# EasyEDA Pro project ProProject_ESP32C3-1.54墨水屏-多功能_2024-05-25.epro, board PCB1
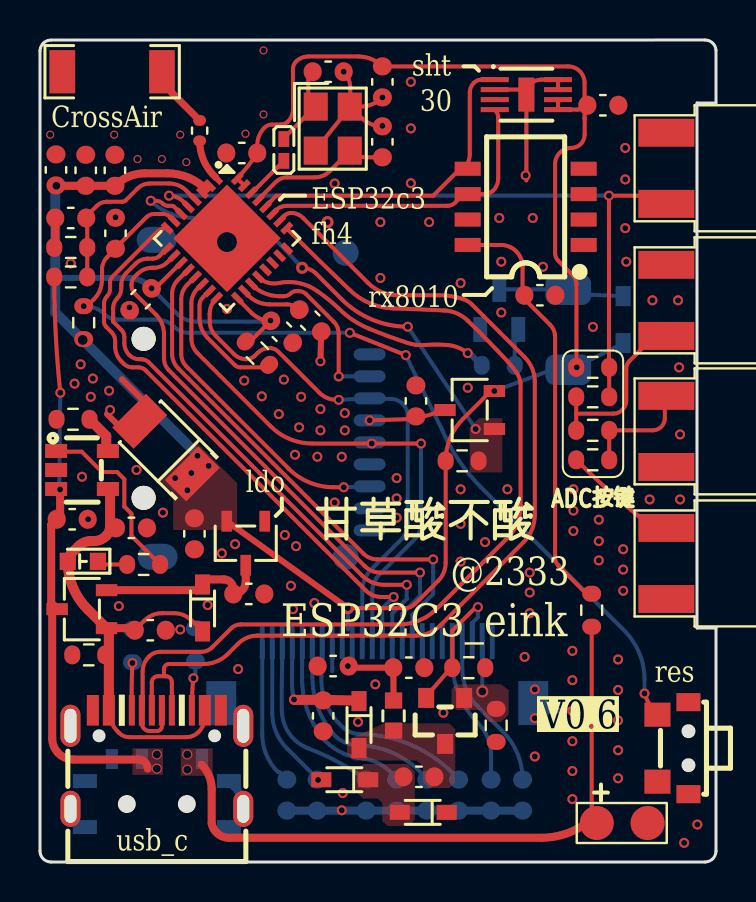
[diagram p1: board, top side]
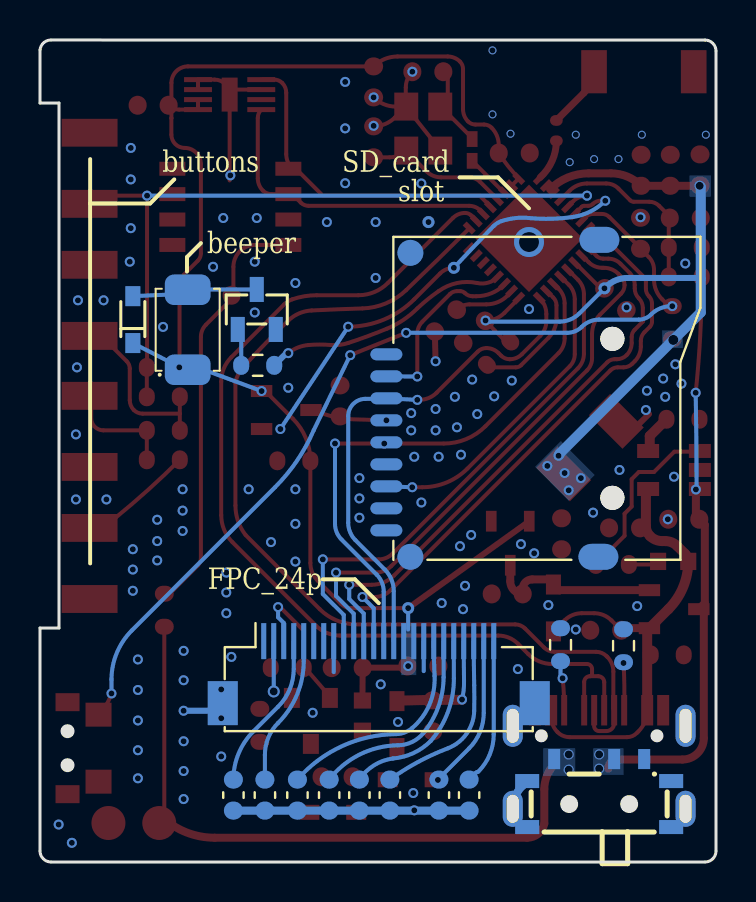
[diagram p2: board, bottom side, seen from below]

Outline 33.8 x 41.1 mm; copper layers: Top Layer, Bottom Layer. Coordinates in mm from the lower left corner of the outline.
Outline path: 0,40.55 arc(0.16,40.94) 0.55,41.1 33.25,41.1 arc(33.62,40.96) 33.8,40.6 33.8,37.95 32.85,37.95 32.85,11.7 33.8,11.7 33.8,0.55 arc(33.64,0.16) 33.25,0 0.55,0 arc(0.16,0.16) 0,0.55 0,40.55
Stack: Top Layer 0.035mm - / Dielectric1 1.51mm FR4 er 4.5 / Bottom Layer 0.035mm -

## Design rules (mm)
template: 自定义配置
spacing copperThickness1oz (default): track to track 0.102, other pairs 0.1 to 0.3
spacing copperThickness2oz: track to track 0.203, other pairs 0.152 to 0.3
track width copperThickness1oz (default): min 0.127, default 0.254, max 2.54
track width copperThickness2oz: min 0.203, default 0.254, max 2.54
differential pair differentialPair (default): width min 0.127, default 0.254, max 2.54; gap min 0.152, default 0.152
via viaSize (default): diameter min 0.4, default 0.61, max 10; hole min 0.3, default 0.305, max 6.3
pour e616 uses copperRegion
pour e955 uses copperRegion
pour e2382 uses 焊盘实心
pour e2386 uses 焊盘实心

## Placement (name value [footprint] x y rotation side)
BUZZER1  DET402  [SMD404Buzzer]  26.42 26.66 90 bottom
C1  10nF  [Capacitor_SMD:C_0603_1608Metric]  1.54 32.2 0 top
C2  100nF  [Capacitor_SMD:C_0603_1608Metric]  24.99 28.34 180 top
C3  100nF  [Capacitor_SMD:C_0603_1608Metric]  28.14 37.84 180 top
C4  1uF  [Capacitor_SMD:C_0603_1608Metric]  13.51 27.07 135 top
C10  10uF  [Capacitor_SMD:C_0603_1608Metric]  18.44 9.72 0 top
C12  4.7uF  [Capacitor_SMD:C_0603_1608Metric]  18.95 4.26 180 top
C17  1uF  [Capacitor_SMD:C_0603_1608Metric]  14.66 9.8 0 top
C18  1uF  [Capacitor_SMD:C_0603_1608Metric]  20.93 3.35 90 bottom
C19  1uF  [Capacitor_SMD:C_0603_1608Metric]  24.13 3.35 90 bottom
C20  1uF  [Capacitor_SMD:C_0603_1608Metric]  19.34 3.35 90 bottom
C21  1uF  [Capacitor_SMD:C_0603_1608Metric]  22.56 3.35 90 bottom
C22  1uF  [Capacitor_SMD:C_0603_1608Metric]  17.83 3.35 90 bottom
C23  1uF  [Capacitor_SMD:C_0603_1608Metric]  16.31 3.35 90 bottom
C24  1uF  [Capacitor_SMD:C_0603_1608Metric]  13.85 3.35 90 bottom
C26  1uF  [Capacitor_SMD:C_0603_1608Metric]  12.34 3.35 90 bottom
C36  10uF  [Capacitor_SMD:C_0603_1608Metric]  10.44 13.41 180 top
C40  1uF  [Capacitor_SMD:C_0603_1608Metric]  14.16 7.31 90 top
C44  10uF  [Capacitor_SMD:C_0603_1608Metric]  7.72 16.41 90 top
C46  100uF  [CASE-B_3528]  6.3 20.72 135 top
C47  10uF  [Capacitor_SMD:C_0603_1608Metric]  0.8 34.61 270 top
C48  1uF  [Capacitor_SMD:C_0603_1608Metric]  2.29 34.59 270 top
C49  100nF  [Capacitor_SMD:C_0603_1608Metric]  3.75 34.59 270 top
C52  1uF  [Capacitor_SMD:C_0603_1608Metric]  17.12 39.01 90 top
C53  10nF  [Capacitor_SMD:C_0603_1608Metric]  10.09 35.45 0 top
C54  12pF  [Capacitor_SMD:C_0603_1608Metric]  14.41 39.52 180 top
C55  12pF  [Capacitor_SMD:C_0603_1608Metric]  17.12 36.01 90 top
C56  100nF  [Capacitor_SMD:C_0603_1608Metric]  12.09 26.51 315 top
C57  100nF  [Capacitor_SMD:C_0603_1608Metric]  5.03 28.14 45 top
C58  100nF  [Capacitor_SMD:C_0603_1608Metric]  5.51 11.59 180 top
C59  10uF  [Capacitor_SMD:C_0603_1608Metric]  4.57 16.71 0 top
C60  10uF  [Capacitor_SMD:C_0603_1608Metric]  1.61 17.14 180 top
C61  100nF  [Capacitor_SMD:C_0603_1608Metric]  3.77 31.44 270 top
C62  100nF  [Capacitor_SMD:C_0603_1608Metric]  18.8 23.06 270 top
CARD1  TF-115-BCP9  [amy_fz:microsd]  8.33 23.21 270 bottom
D2  1N5819WS  [sod-323_l1.8-w1.3-ls2.5-rd]  15.95 6.87 270 top
D3  1N5819WS  [sod-323_l1.8-w1.3-ls2.5-rd]  15.24 4.11 180 top
D4  1N5819WS  [sod-323_l1.8-w1.3-ls2.5-rd]  19.16 2.48 180 top
D5  1N5819WS  [sod-323_l1.8-w1.3-ls2.5-rd]  8.13 12.7 270 top
D6  1N4148WS  [sod-323_l1.8-w1.3-ls2.5-rd]  29.16 27.12 90 bottom
J5  FPC-05FB-24PH20  [fpc 24p]  16.92 8.32 180 bottom
J6  1.25-2A  [conn-th_1.25-2a]  29.11 1.82 0 top
L1  10uH  [0603]  17.68 7.31 270 top
L2  CA-C03  [ANT-SMD_L5.2-W2.0]  3.61 39.52 180 top
L3  24nH  [L0402]  12.19 35.6 90 top
LED1  KT-0603W  [led0603]  2.13 15.03 0 top
OSC1  40MHz  [CRYSTAL-SMD_4P-L3.2-W2.5-BL]  14.64 36.67 270 top
Q1  CJ3401  [SOT-23-3_L2.9-W1.6-P1.90-LS2.8-BR]  2.09 12.64 0 top
Q2  SS8050  [SOT-23-3_L2.9-W1.3-P1.90-LS2.4-BR]  22.96 27.63 270 bottom
Q5  CJ3401  [SOT-23-3_L2.9-W1.6-P1.90-LS2.8-BR]  21.49 22.6 0 top
Q6  CJ3400  [SOT-23_L2.9-W1.3-P1.90-LS2.4-BR]  20.26 7.06 90 top
R1  1kΩ  [Resistor_SMD:R_0603_1608Metric]  22.91 24.84 0 bottom
R2  10Ω  [Resistor_SMD:R_0603_1608Metric]  27.58 12.59 270 top
R4  0Ω  [Resistor_SMD:R_0402_1005Metric]  7.98 36.57 270 top
R5  10kΩ  [Resistor_SMD:R_0603_1608Metric]  27.63 24.73 180 top
R6  5.1kΩ  [Resistor_SMD:R_0603_1608Metric]  7.77 10.87 90 bottom
R7  10kΩ  [Resistor_SMD:R_0603_1608Metric]  27.63 23.26 0 top
R8  10kΩ  [Resistor_SMD:R_0603_1608Metric]  27.63 21.58 180 top
R9  300kΩ  [Resistor_SMD:R_0603_1608Metric]  1.54 29.25 180 top
R10  300kΩ  [Resistor_SMD:R_0603_1608Metric]  1.54 30.73 0 top
R11  10kΩ  [Resistor_SMD:R_0603_1608Metric]  27.63 20.11 0 top
R19  10kΩ  [Resistor_SMD:R_0603_1608Metric]  22.81 6.83 90 top
R20  470mΩ  [Resistor_SMD:R_0603_1608Metric]  21.44 9.72 180 top
R23  5.1kΩ  [Resistor_SMD:R_0603_1608Metric]  4.62 10.81 90 bottom
R25  10kΩ  [Resistor_SMD:R_0603_1608Metric]  5.18 14.88 180 top
R28  5.1kΩ  [Resistor_SMD:R_0603_1608Metric]  1.65 22.14 0 top
R29  10kΩ  [Resistor_SMD:R_0603_1608Metric]  2.19 26.97 90 top
R31  10kΩ  [Resistor_SMD:R_0603_1608Metric]  10.87 25.44 315 top
R32  10kΩ  [Resistor_SMD:R_0603_1608Metric]  21.11 20.06 180 top
R33  100kΩ  [Resistor_SMD:R_0603_1608Metric]  2.44 10.36 180 top
SW1  TS24CA  [SW-SMD_TS24CA]  31.65 5.69 270 top
SW6  B3U-1000P  [卧凯华]  33.63 34.69 270 top
SW7  B3U-1000P  [卧凯华]  33.63 28.09 270 top
SW8  B3U-1000P  [卧凯华]  33.63 21.53 270 top
SW9  B3U-1000P  [卧凯华]  33.63 14.93 270 top
SW10  MSK12CO2-SZ  [sw-th_msk12c02]  5.84 3.45 180 bottom
U2  RX8010SJ  [SOP-8_L7.0方]  24.28 32.76 90 top
U12  TP4054  [TSOT-23-5_L2.9-W1.6-P0.95-LS2.8-BR]  2.1 19.6 180 top
U16  ME6210A33M3G  [SOT-23-3_L3.0-W1.7-P0.95-LS2.9-BR]  10.29 15.94 90 top
U17  SHT30-DIS-B10KS  [DFN-8_L2.5-W2.5-P0.50-BL-EP]  24.32 38.37 270 top
U18  ESP32-C3FH4  [QFN-32_L5.0-W5.0-P0.50-TL-EP3.7]  9.35 31.19 315 top
USB1  TYPE-C16PIN  [usb-c-smd_type-c16pin]  5.84 5.02 0 top

## Footprints (pads in the part's own frame, mm; a bottom-side part is the same pattern mirrored in y, then rotated)
0603
  rect 0.806x0.864 smd: 1(-0.765,0) 2(0.742,0)
amy_fz:microsd
  rrect 0.6x1.6 smd: 1(-2.175,-8.15) 2(-1.075,-8.15) 3(0.025,-8.15) 4(1.125,-8.15) 5(2.225,-8.15) 6(3.325,-8.15) 7(4.425,-8.15) 8(5.525,-8.15) 13(6.625,-8.15)
  rrect 1.3x1.3 smd: 9(7.95,-6.95) 10(-7.25,-6.95)
  rrect 1.3x2 smd: 11(7.95,2.45) 12(-7.9,2.5)
  round 1.2 hole 1.2: 14(5,3.15) 15(-2.95,3.15)
ANT-SMD_L5.2-W2.0
  rect 1.282x2.16 smd: 1(-2.491,0) 2(2.491,0)
Capacitor_SMD:C_0603_1608Metric
  rrect 0.9x0.95 smd: 1(-0.775,0) 2(0.775,0)
CASE-B_3528
  rect 1.506x2.376 smd: 1(-1.861,0) 2(1.861,0)
conn-th_1.25-2a
  rrect 1.7x1.7 smd: 1(-1.27,0.127)
  round 1.7 smd: 2(1.27,0.127)
CRYSTAL-SMD_4P-L3.2-W2.5-BL
  rect 1.4x1.2 smd: 1(-1.1,-0.85) 2(1.1,-0.85) 3(1.1,0.85) 4(-1.1,0.85)
DFN-8_L2.5-W2.5-P0.50-BL-EP
  rect 0.25x1.397 smd: 1(-0.75,-1.581) 2(-0.25,-1.581) 3(0.25,-1.581) 4(0.75,-1.581) 5(0.75,1.581) 6(0.25,1.581) 7(-0.25,1.581) 8(-0.75,1.581)
  rect 1.7x0.8 smd: 9(0,0)
fpc 24p
  rect 0.25x1.8 smd: 1(-5.697,2.719) 2(-5.197,2.719) 3(-4.697,2.719) 4(-4.197,2.719) 5(-3.697,2.719) 6(-3.197,2.719) 7(-2.697,2.719) 8(-2.197,2.719) 9(-1.697,2.719) 10(-1.197,2.719) 11(-0.697,2.719) 12(-0.197,2.719) 13(0.303,2.719) 14(0.803,2.719) 15(1.303,2.719) 16(1.803,2.719) 17(2.303,2.719) 18(2.803,2.719) 19(3.303,2.719) 20(3.803,2.719) 21(4.303,2.719) 22(4.803,2.719) 23(5.303,2.719) 24(5.803,2.719)
  rect 1.5x2.2 smd: 25(-7.747,-0.381) 26(7.853,-0.381)
L0402
  rect 0.79x0.54 smd: 1(-0.545,0) 2(0.545,0)
led0603
  rect 0.806x0.864 smd: 1(0.762,0) 2(-0.745,0)
QFN-32_L5.0-W5.0-P0.50-TL-EP3.7
  rect 0.65x0.28 smd: 1(-2.478,1.75) 2(-2.478,1.25) 3(-2.478,0.75) 4(-2.478,0.25) 5(-2.478,-0.25) 6(-2.478,-0.75) 7(-2.478,-1.25) 8(-2.478,-1.75) 17(2.478,-1.75) 18(2.478,-1.25) 19(2.478,-0.75) 20(2.478,-0.25) 21(2.478,0.25) 22(2.478,0.75) 23(2.478,1.25) 24(2.478,1.75)
  rect 0.28x0.65 smd: 9(-1.75,-2.478) 10(-1.25,-2.478) 11(-0.75,-2.478) 12(-0.25,-2.478) 13(0.25,-2.478) 14(0.75,-2.478) 15(1.25,-2.478) 16(1.75,-2.478) 25(1.75,2.478) 26(1.25,2.478) 27(0.75,2.478) 28(0.25,2.478) 29(-0.25,2.478) 30(-0.75,2.478) 31(-1.25,2.478) 32(-1.75,2.478)
  rect 3.8x3.8 smd: 33(0,0)
Resistor_SMD:R_0402_1005Metric
  rrect 0.54x0.64 smd: 1(-0.51,0) 2(0.51,0)
Resistor_SMD:R_0603_1608Metric
  rrect 0.8x0.95 smd: 1(-0.825,0) 2(0.825,0)
SMD404Buzzer
  rrect 1.524x2.286 smd: 1(-2.051,0) 2(1.949,0)
sod-323_l1.8-w1.3-ls2.5-rd
  rect 1x0.75 smd: 1(-1.173,0) 2(1.173,0)
SOP-8_L7.0方
  rect 0.7x1.3 smd: 1(-1.905,-2.9) 2(-0.635,-2.9) 3(0.635,-2.9) 4(1.905,-2.9) 5(1.905,2.9) 6(0.635,2.9) 7(-0.635,2.9) 8(-1.905,2.9)
SOT-23-3_L2.9-W1.3-P1.90-LS2.4-BR
  rect 1.25x0.7 smd: 1(1,-0.95) 2(1,0.95) 3(-1,0)
SOT-23-3_L2.9-W1.6-P1.90-LS2.8-BR
  rect 1.07x0.6 smd: 1(1.235,-0.95) 2(1.235,0.95) 3(-1.235,0)
SOT-23-3_L3.0-W1.7-P0.95-LS2.9-BR
  rect 1.038x0.532 smd: 1(1.101,-0.95) 2(1.101,0.95) 3(-1.101,0)
SOT-23_L2.9-W1.3-P1.90-LS2.4-BR
  rect 1x0.8 smd: 1(1.15,-0.95) 2(1.15,0.95) 3(-1.15,0)
SW-SMD_TS24CA
  rect 0.9x1.2 smd: 1(-2.3,0.775) 2(2.3,0.775)
  rect 1.2x1.3 smd: 3(-1.675,-0.775) 4(1.675,-0.775)
sw-th_msk12c02
  rect 0.6x1 smd: 1(-2.25,1.7) 2(0.75,1.7) 3(2.25,1.7)
  rect 1.2x0.7 smd: 4(-3.6,-1.7) 4(-3.6,0.6) 4(3.6,-1.7) 4(3.6,0.6)
TSOT-23-5_L2.9-W1.6-P0.95-LS2.8-BR
  rect 1.1x0.7 smd: 1(1.294,-0.951) 2(1.294,-0.001) 3(1.294,0.951) 4(-1.294,0.951) 5(-1.294,-0.949)
usb-c-smd_type-c16pin
  oval 1x2.1 hole 0.6x1.7: 1(-4.32,1.788) 2(4.32,1.788)
  oval 1x1.8 hole 0.6x1.4: 3(-4.32,-2.362) 4(4.32,-2.362)
  rect 0.6x1.524 smd: A1B12(-3.2,2.566) A4B9(-2.4,2.566) B1A12(3.2,2.566) B4A9(2.4,2.566)
  rect 0.3x1.524 smd: A5(-1.25,2.566) A6(-0.25,2.566) A7(0.25,2.566) B5(1.75,2.566) B6(0.75,2.566) B7(-0.75,2.566)
卧凯华
  custom 1.397x2.794 smd: 1(-1.778,-2.31) 2(1.778,-2.31)

## Nets
As in the schematic, except:
TIMEVCC: J6.1 R2.2 SW10.1

Pads without a net: CARD1 1 8 9 14 15; J5 1 6 7; L2 2; SW10 3; U2 1 2 3 7; U17 3

## Via types
v1: diameter 0.5, hole 0.3, Top Layer to Bottom Layer, 147 vias
v2: diameter 0.4, hole 0.3, Top Layer to Bottom Layer, 9 vias
v3: diameter 0.6, hole 0.3, Top Layer to Bottom Layer, 4 vias
v4: diameter 1.5, hole 1, Top Layer to Bottom Layer, 1 via
v5: diameter 0.5, hole 0.4, Top Layer to Bottom Layer, 5 vias
v6: diameter 0.51, hole 0.5, Top Layer to Bottom Layer, 1 via
v7: diameter 0.6, hole 0.4, Top Layer to Bottom Layer, 1 via

## Routing (per net, layer and track width the routed paths; a pad name or vN(x,y) marks a point on that pad's centre or on a via; arc(x,y) is an arc through that point)
3.3V: length 117.5
  Top Layer w0.2: U18.31 U18.32 ; 27.23,37.73 27.23,37.19 arc(27.23,37.19) 27.23,37.19 27.23,36.37 arc(27.04,35.9) 26.57,35.71 arc(25.99,35.47) 25.76,34.89 25.76,30.44 arc(25.8,30.24) 25.91,30.07 26.64,29.33 arc(26.78,29.13) 26.82,28.9 26.82,24.76 arc(26.82,24.75) R5.2 ; 27.23,37.73 27.23,38.96 arc(26.99,39.54) 26.4,39.78 C52.2 arc(16.57,40.15) 15.92,40.28 13.41,40.28 arc(13.08,40.21) 12.8,40.02 arc(12.69,39.86) 12.65,39.66 12.65,37.64 arc(12.58,37.31) 12.4,37.03 arc(12.23,36.91) 12.03,36.87 11.59,36.87 arc(11.4,36.83) 11.23,36.72 arc(10.96,36.32) 10.86,35.84 C53.2 arc(10.39,34.78) 9.84,34.17 ; 27.23,37.73 arc(27.3,37.78) C3.2 ; 27.23,37.73 arc(27.04,37.65) 26.84,37.62 U17.5 25.9,38.12 ; v3(5.58,28.69) 5.77,28.69 7.04,29.96 ; v3(15.39,12.69) 18.24,12.69 arc(18.52,12.75) 18.76,12.91 19.91,14.07 arc(20.19,14.47) 20.28,14.95 R32.2 arc(20.51,21.2) 21.15,22.16 22.41,23.42 arc(22.55,23.52) v1(22.72,23.55) ; U18.3 8.3,33.64 U18.2 ; 9.84,28.2 10.58,27.46 arc(11.02,27.16) C56.1 10.67,26.19 arc(10.49,26.07) R31.1
  Top Layer w0.3: L1.1 C10.1 15.47,9.72 v1(15.39,9.8) ; v3(15.39,12.69) 9.34,17.04
  Top Layer w0.4: 8.3,33.64 arc(7.41,34.23) 6.36,34.44 5.25,34.44 arc(4.44,34.27) C49.2 C48.2 v5(0.82,33.81) arc(0.8,33.82) C47.2
  Bottom Layer w0.2: v1(22.72,23.55) 26.42,24.91 27.38,25.04 D6.1 ; v3(15.39,12.69) 15.39,11.63 ; v3(5.58,28.69) 6.83,27.43 arc(7.29,27.13) 7.82,27.02 11.36,27.02 arc(11.42,27.03) 11.48,27.07
  Bottom Layer w0.3: v3(5.58,28.69) 5.51,28.75 arc(5.01,29.09) 4.42,29.2 0.85,29.2 arc(0.8,29.19) 0.76,29.17
  Bottom Layer w0.5: 7.82,20.36 7.82,20.42 v6(2.13,26.11) 0.76,27.48 0.76,33.76 v5(0.82,33.81)
  vias: v1(6.76,19.2) v1(7.37,18.59) v1(7.57,19.45) v1(7.87,20.31) v1(8.43,19.81) v1(11.52,27.08) v1(26.84,24.73)
GND: length 42
  Top Layer w0.2: 25.9,38.62 25.9,39.12 25.07,39.12 arc(24.54,38.9) U17.9 ; 22.74,38.62 24.07,38.62 arc(24.25,38.55) U17.9 ; 15.51,37.77 15.51,38.72 arc(15.43,39.15) v1(15.18,39.52) ; 15.51,37.77 16.06,37.23 arc(16.54,36.9) C55.2 ; 15.51,37.77 13.76,35.57 ; 15.51,37.77 16,37.77 arc(16.61,37.89) v1(17.12,38.23) ; U17.9 24.32,34.08
  Top Layer w0.3: 4.42,21.33 3.35,22.4 ; 5.63,22.61 4.1,24.14 ; 14.06,26.52 v1(14.02,25.04)
  Top Layer w0.4: C1.1 0.76,30.78 arc(0.75,30.74) R10.1
  Bottom Layer w0.2: J5.17 14.61,9.54 ; J5.8 19.11,9.49
  Bottom Layer w0.3: v1(26.62,7.56) 25.04,7.56 arc(24.77,7.67) J5.25
  Bottom Layer w0.4: C19.1 C21.1 C18.1 C20.1 C22.1 C23.1 C24.1 C26.1 ; 9.54,3.95 9.69,3.8 arc(10.04,3.28) USB1.4
  vias: v1(1.54,29.93) v1(1.73,23.92) v1(2.03,24.89) v1(2.1,19.27) v1(2.41,17.14) v1(2.54,23.26) v1(2.64,24.17) v1(3.45,23.57) v1(3.5,22.6) v1(3.77,32.24) v1(3.94,12.8) v1(4.47,27.73) v1(4.83,19.6) v1(6.15,17.47) v1(7.01,11.63) v1(8.38,12.85) v1(9.09,15.44) v1(9.35,27.65) v1(9.75,15.89) v1(9.91,9.65) v1(10.21,24.07) v1(11.09,23.29) v1(11.94,22.4) v1(12.19,24.12) v1(12.24,16.35) v1(12.55,13.81) v1(12.65,12.64) v1(12.75,20.36) v1(12.8,15.79) v1(12.95,21.74) v1(13.06,23.26) v1(13.72,12.95) v1(13.87,20.26) v1(14.02,22.65) v1(14.02,21.58) v1(14.73,33.93) v1(14.73,17.98) v1(15.09,20.26) v1(15.14,3.45) v1(15.09,2.58) v1(15.24,22.45) v1(15.24,21.58) v1(15.9,7) v1(16.76,8.88) v1(17.02,32) v1(17.02,29.2) v1(17.12,36.81) v1(17.83,19.2) v1(17.83,18.18) v1(17.83,17.22) v1(18.54,39.01) v1(18.54,36.68) v1(18.54,33.94) v1(19.46,32) v1(20.17,7.46) v1(21.03,28.95) v1(21.03,18.64) v1(21.03,16.91) v1(21.03,15.02) v1(21.39,23.71) v1(22.25,16) v1(22.96,32.2) v1(23.06,30.02) v1(23.06,27.48) v1(23.37,18.64) v1(24.23,10.26) v1(24.28,34.33) v1(24.49,14.47) v1(24.49,13.48) v1(24.49,12.44) v1(24.64,32.2) v1(24.74,8.63) v1(24.74,7.19) v1(24.74,5.28) v1(25.15,29.76) v1(26.62,10.56) v1(26.62,9.09) v1(26.62,6.04) v1(26.62,4.55) v1(26.62,3.15) v1(26.67,18.64) v1(26.67,17.57) v1(26.67,16.55) v1(27.65,26.76) v1(27.94,17.11) v1(27.94,16.05) v1(27.94,15.08) v1(28.91,10.13) v1(28.91,8.6) v1(28.91,7.08) v1(28.91,5.59) v1(28.91,4.19) v1(29.16,15.64) v1(29.16,14.62) v1(29.16,13.56) v1(29.26,35.71) v1(29.26,34.13) v1(29.26,31.69) v1(29.31,30.02) v1(30.48,18.13) v1(30.62,28.09) v1(31.9,28.09) v1(31.95,24.73) v1(32,21.38) v1(32,18.13) v1(32.21,0.96) v1(32.87,1.87) v2(0.51,36.37) v2(3.71,36.37) v2(4.88,35.15) v2(6.1,35.15) v2(7.01,36.37) v2(7.31,35) v2(10.28,36.42) v2(11.18,40.58) v2(11.18,37.38) v3(14.38,32) v4(9.35,31)
VIN_5V: length 25.1
  Top Layer w0.2: C58.2 5.23,12.08 arc(5.63,12.35) 6.1,12.44 6.71,12.44 arc(7.18,12.35) 7.57,12.08 8.12,11.53 arc(8.12,11.53) D5.2 ; USB1.B4A9 8.24,7.26 arc(8.16,6.85) 7.93,6.5 arc(7.64,6.31) 7.31,6.24 4.45,6.24 arc(4.19,6.29) 3.96,6.45 3.88,6.53 arc(3.56,7.01) USB1.A4B9
  Top Layer w0.4: Q1.1 4.63,11.69 C58.2
  Top Layer w0.5: USB1.A4B9 3.44,11.58 arc(3.41,11.66) Q1.1 2.38,12.64 arc(1.65,13.74) LED1.2 arc(1.43,15.23) 1.54,15.41 1.93,15.8 arc(2.21,15.98) 2.54,16.05 2.69,16.05 arc(3.02,16.11) 3.3,16.3 arc(3.45,16.53) 3.5,16.79 3.5,18.38 arc(3.48,18.53) U12.4
ADC_BAT: length 9.4
  Top Layer w0.2: U18.4 7.32,33.57 arc(6.92,33.83) 6.45,33.93 5.49,33.93 arc(5.16,33.86) 4.88,33.67 4.29,33.09 arc(4.21,33.03) 4.12,33.01 3.34,33.01 arc(3.07,32.96) 2.84,32.81 2.37,32.33 arc(2.33,32.27) C1.2 2.36,32.15 R10.2 R9.1
BAT+: length 29.2
  Top Layer w0.2: R9.2 arc(0.79,26.36) v1(1.02,23.46)
  Top Layer w0.4: v1(1.01,18.63) 1.01,17.31 C60.2 0.56,16.86 0.56,12.94 Q1.3 arc(0.68,12.57) 0.61,12.39 0.61,6.19 arc(0.92,5.44) 1.68,5.12 4.93,5.12 arc(5.25,4.99) 5.38,4.67
  Bottom Layer w0.2: 0.97,18.63 arc(0.98,21.04) v1(1.02,23.46)
  vias: v5(5.84,5.38) v5(5.84,4.67)
CHIP_EN: length 46.4
  Top Layer w0.2: v1(15.49,26.46) v1(18.29,25.34) ; U18.7 6.51,32.25 arc(6.35,32.36) 6.15,32.4 5.7,32.4 arc(5.5,32.36) 5.33,32.25 3.79,30.71 arc(3.78,30.69) C61.2 3.37,30.26 arc(3.17,29.96) 3.1,29.61 3.1,29.12 arc(2.99,28.59) 2.69,28.14 2.47,27.91 arc(2.34,27.82) v1(2.19,27.79) ; SW1.3 arc(30.49,7.86) v1(30.23,8.43)
  Bottom Layer w0.2: v1(15.49,26.46) 7.44,26.46 arc(7.04,26.54) 6.71,26.77 arc(6.31,27.03) 5.85,27.12 3.86,27.12 arc(3.53,27.19) 3.25,27.38 arc(2.79,27.68) 2.24,27.79 v1(2.19,27.79) ; v1(18.29,25.34) 20.12,21.58 arc(20.95,20.07) 22.05,18.74 29.21,11.58 arc(29.96,10.45) 30.23,9.12 v1(30.23,8.43)
EPD_BUSY: length 26.5
  Top Layer w0.2: 7.4,29.61 6.9,29.12 arc(6.68,28.78) 6.6,28.39 6.6,25.42 arc(6.68,25.02) 6.91,24.68 16.17,15.42 arc(16.49,15.21) 16.87,15.13 v1(19.66,15.13)
  Bottom Layer w0.2: v1(19.66,15.13) 19.66,13.41 18.61,12.36 J5.9
EPD_CS: length 29.2
  Top Layer w0.2: v1(17.68,13.25) 17.07,13.25 arc(16.65,13.34) 16.29,13.58 5.28,24.58 arc(5.11,24.69) 4.92,24.73 4.62,24.73 arc(4.39,24.78) 4.19,24.91 4.06,25.04 arc(3.84,25.38) 3.76,25.77 3.76,26.05 arc(3.71,26.29) 3.58,26.49 3.31,26.76 arc(3.23,26.88) 3.2,27.02 3.2,27.92 arc(3.24,28.12) 3.35,28.29 arc(3.47,28.46) 3.5,28.66 3.5,29 arc(3.53,29.14) 3.61,29.26 5.85,31.5 arc(6.07,31.65) 6.34,31.7
  Bottom Layer w0.2: v1(17.68,13.25) 17.11,12.69 J5.12
EPD_DC: length 28.7
  Top Layer w0.2: v1(18.34,13.86) 17.22,13.86 arc(16.61,13.98) 16.09,14.33 5.44,24.99 arc(5.27,25.1) 5.07,25.14 4.96,25.14 arc(4.7,25.19) 4.47,25.34 arc(4.28,25.62) 4.22,25.96 4.22,26.26 arc(4.18,26.45) 4.07,26.6 3.66,27.02 3.66,27.7 arc(3.71,27.96) 3.86,28.19 arc(4.01,28.41) 4.06,28.68 4.06,28.85 arc(4.13,29.18) 4.32,29.46 4.78,29.92 arc(5.06,30.1) 5.39,30.17 5.64,30.17 arc(5.82,30.21) 5.98,30.31 6.34,30.67
  Bottom Layer w0.2: v1(18.34,13.86) 18.34,13.15 17.61,12.43 J5.11
EPD_RES: length 28.2
  Top Layer w0.2: 6.69,30.32 6.37,29.99 arc(6.06,29.78) 5.69,29.71 5.61,29.71 arc(5.21,29.63) 4.88,29.41 4.75,29.28 arc(4.62,29.08) 4.57,28.85 arc(4.62,28.61) 4.75,28.41 5.8,27.36 arc(6.09,26.93) 6.2,26.41 6.2,25.19 arc(6.26,24.86) 6.45,24.58 16.24,14.8 arc(16.6,14.56) 17.02,14.47 v1(19,14.47)
  Bottom Layer w0.2: J5.10 18.11,12.42 19,13.3 v1(19,14.47)
GDR: length 2.5
  Bottom Layer w0.2: J5.2 v7(22.11,8.53)
GPIO1/U1RXD: length 36.3
  Top Layer w0.2: 7.42,32.76 7.15,33.03 arc(6.83,33.24) v1(6.45,33.32) ; R7.2 R5.1 arc(28.45,24.75) 28.45,24.76 v1(28.45,33.32) 30.49,33.32 arc(31.02,33.21) 31.47,32.91
  Bottom Layer w0.2: v1(6.45,33.32) v1(28.45,33.32)
GPIO2: length 22.9
  Top Layer w0.2: v1(5.54,33.06) 5.78,33.06 arc(5.98,33.02) 6.15,32.91 arc(6.26,32.84) 6.39,32.81 6.6,32.81 arc(6.66,32.8) 6.71,32.77 U18.6 ; v1(18.39,26.77) arc(16.6,27.12) 15.09,28.14 13.8,29.42 arc(13.48,29.64) v3(13.11,29.71)
  Bottom Layer w0.2: v1(21.78,21.65) v1(18.39,26.77) ; v1(5.54,33.06) arc(6.28,32.53) 7.16,32.25 arc(8.25,32.16) 9.35,32.2 arc(10.04,32.2) 10.72,32.05 arc(10.94,31.95) 11.12,31.79 arc(12.12,30.76) v3(13.11,29.71)
GPIO7: length 16.3
  Top Layer w0.2: v1(15.19,18.74) 14.68,18.74 arc(13.46,18.98) 12.43,19.67 7.31,24.78 arc(7.13,25.07) 7.06,25.4 7.06,28.14 arc(7.14,28.53) 7.36,28.87 7.75,29.26
  Bottom Layer w0.2: v1(15.19,18.74) CARD1.7
GPIO8/PWM: length 27.4
  Top Layer w0.2: 8.11,28.9 7.88,28.67 arc(7.65,28.33) 7.57,27.93 7.57,26.18 arc(7.65,25.78) 7.87,25.44 11.53,21.79 arc(12.49,21.15) 13.61,20.92 v1(16.59,20.92) v1(19.05,20.92)
  Bottom Layer w0.2: v1(19.05,20.92) 19.05,16.91 arc(18.97,16.49) 18.73,16.13 16.97,14.37 arc(16.71,13.98) 16.61,13.52 J5.13
GPIO10: length 25.7
  Top Layer w0.2: 14.83,23.11 arc(14.36,23.2) 13.97,23.47 11.91,25.52 arc(11.72,25.65) 11.48,25.7 arc(11.15,25.63) 10.87,25.45 10.75,25.32 arc(10.55,25.19) 10.31,25.14 arc(9.98,25.21) 9.71,25.39 8.79,26.31 arc(8.56,26.65) 8.48,27.04 8.48,27.4 arc(8.57,27.83) 8.81,28.2
  Bottom Layer w0.2: v1(14.94,23.11) CARD1.3 16.51,23.16 17.53,23.16 arc(18.14,22.9) 18.39,22.3 18.39,16.96 arc(18.3,16.49) 18.03,16.09 16.56,14.62 arc(16.23,14.13) 16.11,13.54 J5.14
GPIO11: length 3.1
  Top Layer w0.2: 10.2,28.55 10.42,28.32 arc(10.91,28) 11.48,27.88 12.33,27.88 arc(12.67,27.81) C4.2
GPIO12: length 9.3
  Top Layer w0.2: v1(14.94,24.28) 14.94,26.41 arc(14.87,26.74) 14.68,27.02 13.3,28.4 arc(13.14,28.51) 12.95,28.54 12.79,28.54 arc(12.66,28.52) 12.55,28.44 arc(12.38,28.33) 12.18,28.29 11.99,28.29 arc(11.23,28.44) 10.58,28.87 10.55,28.9
  Bottom Layer w0.2: v1(14.94,24.28) CARD1.2
GPIO13: length 12.5
  Top Layer w0.2: 10.9,29.26 arc(11.38,28.97) 11.94,28.95 arc(12.95,28.95) 13.87,28.54 arc(14.42,28.13) 14.94,27.68 arc(15.65,27.1) 16.46,26.66 arc(17.42,26.29) 18.39,25.95 arc(18.82,25.86) 19.25,25.85 arc(19.81,25.87) 20.37,25.85 arc(20.91,25.72) v1(21.39,25.44)
  Bottom Layer w0.3: v1(21.39,25.44) 21.48,25.44 R1.1
GPIO20: length 15.6
  Top Layer w0.2: 11.61,32.41 11.78,32.58 arc(12.04,32.75) 12.34,32.81 20.37,32.81 arc(20.58,32.85) 20.76,32.97 21.18,33.4 22.23,33.4 arc(22.46,33.44) 22.66,33.57 arc(22.85,33.85) 22.91,34.19 22.91,37.2 arc(22.87,37.43) U17.4
GPIO21: length 16.2
  Top Layer w0.2: 11.26,32.76 11.81,33.32 19.66,33.32 21.01,34.67 21.18,34.67 arc(21.41,35) 21.49,35.4 21.49,38.47 arc(21.54,38.73) 21.69,38.96 arc(21.87,39.08) 22.09,39.12 22.74,39.12
GPIOP_BOOT: length 6.3
  Top Layer w0.2: 8.46,28.55 8.14,28.23 arc(8.02,28.05) 7.98,27.83 7.98,27.19 arc(8.08,26.66) 8.38,26.21 9.75,24.84 arc(9.87,24.76) 10.01,24.73 11.15,24.73 arc(11.31,24.77) R31.2
PREVGH: length 6.2
  Top Layer w0.5: v1(12.7,8.12) 12.72,8.11 14.18,8.11 15.93,8.07 D2.1
  Bottom Layer w0.2: J5.21 arc(12.61,10.04) 12.6,9.04 arc(12.62,8.58) v1(12.7,8.12)
PREVGL: length 7.7
  Bottom Layer w0.2: J5.23 11.61,7.45 arc(11.8,6.49) 12.34,5.68 13.82,4.21 arc(13.85,4.17) C24.2
  vias: v1(13.9,4.1)
RESE: length 7.5
  Top Layer w0.2: 19.31,8.21 19.3,8.27 20.55,9.71 R20.2 20.61,11.56 21.79,12.74 v1(21.9,12.74)
  Bottom Layer w0.2: v1(21.9,12.74) 21.9,12.24 21.61,11.96 J5.3
TIMEVCC: length 32.8
  Top Layer w0.2: R2.2 27.58,2.55 arc(27.6,2.37) 27.65,2.21 arc(27.71,2.09) 27.79,1.99 arc(27.81,1.96) 27.84,1.93
  Top Layer w0.4: 8.08,4.87 arc(8.45,4.31) 8.59,3.64 8.59,1.92 arc(8.89,1.41) 9.44,1.21 25.07,1.21 arc(26.45,1.47) 27.65,2.21 arc(27.7,2.25) 27.74,2.29 ; 27.84,2.03 arc(27.81,2.01) 27.79,1.99
  vias: v5(7.37,5.38) v5(7.37,4.62)
USB_D+: length 49.7
  Top Layer w0.2: USB1.B6 6.59,9 arc(6.51,9.2) 6.3,9.29 ; 6.3,9.29 5.89,9.29 arc(5.68,9.2) 5.59,8.99 5.59,7.59 arc(5.59,7.59) USB1.A6 ; 6.3,9.29 arc(6.23,9.32) 6.2,9.39 6.2,9.65 arc(6.27,9.83) 6.45,9.9 8.18,9.9 arc(8.84,10.03) 9.39,10.4 9.91,10.92 arc(10.36,11.22) 10.89,11.32 18.8,11.32 arc(19.45,11.45) 20.01,11.83 24.18,16 arc(24.59,16.62) 24.74,17.35 24.74,24.02 arc(24.61,24.68) 24.24,25.24 21.59,27.88 arc(21.4,28.03) 21.18,28.14 arc(20.58,28.29) 19.96,28.34 17.88,28.34 arc(17.08,28.5) 16.41,28.95 13.15,32.2 arc(12.88,32.39) 12.55,32.46 arc(12.38,32.42) 12.24,32.33 11.96,32.05
USB_D-: length 47.7
  Top Layer w0.2: 6.1,6.8 arc(6.02,6.62) 5.84,6.55 5.49,6.55 arc(5.21,6.66) 5.09,6.94 USB1.B7 arc(5.12,7.63) 5.13,7.68 5.13,9.52 arc(5.21,9.92) 5.44,10.26 5.47,10.29 arc(5.71,10.45) 5.99,10.51 8.08,10.51 arc(8.36,10.57) 8.6,10.73 9.55,11.68 arc(9.78,11.83) 10.04,11.88 18.03,11.88 arc(19,12.09) 19.81,12.64 23.52,16.35 arc(23.9,17.05) 24.03,17.82 24.03,23.92 arc(23.96,24.21) 23.82,24.48 arc(23.63,24.74) 23.42,24.99 arc(22.42,26.04) 21.39,27.07 arc(20.85,27.43) 20.22,27.58 arc(18.95,27.64) 17.68,27.68 arc(16.5,27.93) 15.49,28.59 arc(13.9,30.14) 12.32,31.7
$1N1430: length 2.5
  Top Layer w0.2: USB1.B5 arc(7.61,8.39) v1(7.67,9.19)
  Bottom Layer w0.2: v1(7.67,9.19) 7.77,9.29 R6.1
$1N1433: length 2.4
  Top Layer w0.2: USB1.A5 arc(4.58,8.77) v1(4.62,9.95)
$1N1643: length 8.6
  Top Layer w0.4: 8.13,14.13 9.19,14.13 arc(9.53,13.99) 9.66,13.66 ; Q1.2 7.84,13.59 arc(8.05,13.68) D5.1 ; U16.3 10.29,14.03 arc(10.1,13.59) C36.2
$1N2213: length 21.2
  Top Layer w0.2: U2.8 23.04,30.86 arc(23.81,30.54) 24.13,29.76 24.13,28.43 arc(24.16,28.37) C2.2 arc(24.25,28.16) 24.35,28.02 25.5,26.87 arc(25.69,26.59) 25.76,26.25 25.76,15.2 arc(25.8,15) 25.91,14.83 27.13,13.6 arc(27.34,13.46) R2.1
$1N9961: length 7.9
  Bottom Layer w0.2: J5.4 21.11,9.65 arc(21.32,8.63) 21.9,7.77 23.13,6.53 arc(23.87,5.42) C19.2
$1N9962: length 7.4
  Bottom Layer w0.2: J5.5 20.61,10.05 arc(20.95,8.37) 21.9,6.95 arc(22.38,6.22) 22.56,5.36 C21.2
$1N9965: length 7.3
  Bottom Layer w0.2: C26.2 12,4.47 arc(11.95,4.5) 11.89,4.52 arc(11.31,5.37) 11.11,6.38 J5.24
$1N9981: length 9.2
  Bottom Layer w0.2: C23.2 arc(14.91,5) 13.41,5.68 arc(12.46,6.42) 12.09,7.56 arc(12.08,8.2) 12.09,8.83 arc(12.11,9.94) J5.22
$1N9982: length 9.4
  Bottom Layer w0.2: C22.2 arc(17.11,4.83) 16.15,5.18 arc(15.13,5.45) 14.27,6.05 arc(13.4,7.51) 13.11,9.19 arc(13.11,10.12) J5.20
$1N9983: length 10.3
  Bottom Layer w0.2: C20.2 arc(17.82,5.37) 15.9,5.84 arc(15.2,6) 14.63,6.45 arc(13.89,7.76) 13.62,9.24 arc(13.62,10.14) J5.19
$1N9984: length 11.2
  Bottom Layer w0.2: J5.18 arc(14.1,10.17) 14.07,9.29 arc(14.33,7.87) 15.19,6.7 arc(15.57,6.48) 16,6.39 arc(18.71,5.79) C18.2
$1N10003: length 3.8
  Top Layer w0.2: v1(16.48,22.08) 18.8,22.16 Q5.3
$1N10008: length 5.9
  Top Layer w0.2: R11.1 arc(28.38,18.62) 30.02,17.22 arc(30.7,16.84) 31.47,16.71
$1N10009: length 5.9
  Top Layer w0.2: R11.2 R8.1 30.63,21.58 arc(31.06,21.76) 31.24,22.19 31.24,23.08 arc(31.31,23.24) 31.47,23.31
$1N10010: length 9
  Top Layer w0.2: R8.2 26.81,22.42 ; 26.81,22.42 28.67,22.42 arc(28.91,22.47) 29.11,22.6 arc(29.26,22.83) 29.31,23.09 29.31,24.67 arc(29.35,24.87) 29.46,25.04 30.21,25.79 arc(30.79,26.17) 31.47,26.31 ; 26.81,22.42 R7.1
$1N10078: length 7.2
  Top Layer w0.2: C55.1 16.32,35.24 arc(15.88,35.32) 15.51,35.57 14.48,34.54 arc(14.14,34.31) 13.74,34.23 12.34,34.23 arc(12.05,34.17) 11.79,34.01 10.9,33.11
$1N10086: length 2.1
  Top Layer w0.349: 8.79,34.23 arc(8.19,35.06) R4.2
$1N10087: length 3.2
  Top Layer w0.349: R4.1 6.61,38.45 arc(6.25,38.99) 6.13,39.62
$1N10089: length 6.3
  Bottom Layer w0.2: Q2.3 26.2,28.63 26.42,28.41 D6.2
$1N10090: length 1.9
  Bottom Layer w0.2: Q2.1 23.74,26.46 R1.2
$1N10110: length 2.3
  Top Layer w0.2: L3.1 10.6,33.47 U18.30
$1N10113: length 4.3
  Top Layer w0.2: L3.2 12.19,36.2 13.76,37.77 13.41,38.12 13.41,39.29 C54.2
$1N15185: length 1.9
  Top Layer w0.5: R28.2 3.31,21.3 3.31,20.58
$1N15189: length 9
  Top Layer w0.2: R25.1 4.57,16.31 4.57,17.42 4.22,17.77 4.22,19.14 3.86,19.5 3.1,19.5 2.08,20.52 0.84,20.52 U12.1
$1N17707: length 1.5
  Top Layer w0.2: LED1.1 3.05,14.88 R25.2

## Copper pours and planes (outline as drawn; the poured copper is in the pictures)
3.3V on Top Layer: 5.99,20.97 9.85,20.97 9.85,16.61 5.99,16.61
3.3V on Bottom Layer: 0.25,34.33 1.32,34.33 1.32,33.27 0.25,33.27
3.3V on Bottom Layer: 6.06,21.05 9.04,21.05 9.04,18.06 6.06,18.06
3.3V on Bottom Layer: 14.99,11.93 15.74,11.93 15.74,9.34 14.99,9.34
GND on Top Layer: 6.38,12.47 7.6,12.47 7.6,10.89 6.38,10.89
GND on Top Layer: -4.88,42.46 36.02,42.46 36.02,-1.78 -4.88,-1.78
GND on Bottom Layer: 6.55,12.49 7.77,12.49 7.77,10.92 6.55,10.92
GND on Bottom Layer: -0.81,44.04 37.74,44.04 37.74,-3.05 -0.81,-3.05
BAT+ on Top Layer: 4.62,5.68 6.15,5.68 6.15,4.36 4.62,4.36
BAT+ on Bottom Layer: 4.62,5.68 6.15,5.68 6.15,4.36 4.62,4.36
GDR on Top Layer: 20.57,8.89 23.43,8.89 23.43,7 20.57,7
GPIO2 on Top Layer: 21.49,22.19 23.11,22.19 23.11,19.48 21.49,19.48
TIMEVCC on Top Layer: 7.04,5.68 8.64,5.68 8.64,4.31 7.04,4.31
TIMEVCC on Bottom Layer: 7.04,5.68 8.64,5.68 8.64,4.31 7.04,4.31
$1N9944 on Top Layer: 15.79,4.9 18.75,4.9 18.75,1.8 15.79,1.8
$1N9952 on Top Layer: 15.35,6.93 20.76,6.93 20.76,3.7 15.35,3.7

Small or netless copper shapes (teardrops, artwork), in the pictures only: 1 on Bottom Layer

## Text on the board
Bottom Solder Mask Layer: V0.6
Bottom Silkscreen Layer: slot | SD_card | FPC_24p | beeper | buttons
Top Silkscreen Layer: + | CrossAir | usb_c | ldo | ESP32c3 / fh4 | rx8010 | sht / 30 | res | @2333 | V0.6 | ESP32C3_eink | ADC按键 | 甘草酸不酸
